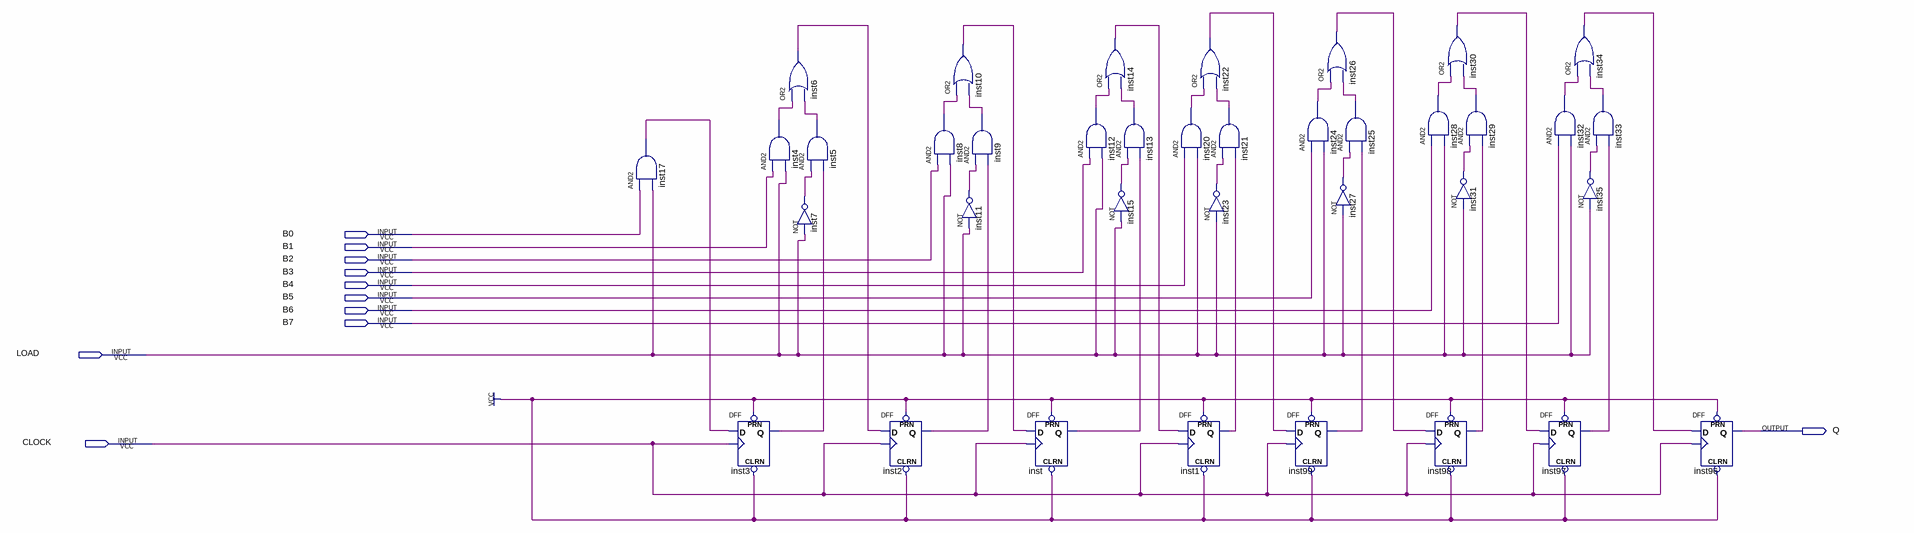
[diagram p0: schematic sheet]
// Quartus schematic PISO.bdf as structural Verilog: 37 symbols, 11 pins
module PISO (
  input  B0,
  input  B1,
  input  B2,
  input  B3,
  input  B4,
  input  B5,
  input  B6,
  input  B7,
  input  LOAD,
  input  CLOCK,
  output Q
);

  wire inst1_q, inst2_q, inst3_q, inst4_out, inst5_out, inst6_out, inst7_out, inst8_out, inst9_out,
       inst10_out, inst11_out, inst12_out, inst13_out, inst14_out, inst15_out, inst17_out, inst20_out,
       inst21_out, inst22_out, inst23_out, inst24_out, inst25_out, inst26_out, inst27_out, inst28_out,
       inst29_out, inst30_out, inst31_out, inst32_out, inst33_out, inst34_out, inst35_out, inst97_q,
       inst98_q, inst99_q, inst_q;

  and inst17 (inst17_out, B0, LOAD);
  DFF inst3 (.CLRN(1'b1), .CLK(CLOCK), .D(inst17_out), .PRN(1'b1), .Q(inst3_q));
  or inst6 (inst6_out, inst4_out, inst5_out);
  and inst4 (inst4_out, B1, LOAD);
  and inst5 (inst5_out, inst7_out, inst3_q);
  not inst7 (inst7_out, LOAD);
  DFF inst2 (.CLRN(1'b1), .CLK(CLOCK), .D(inst6_out), .PRN(1'b1), .Q(inst2_q));
  and inst8 (inst8_out, B2, LOAD);
  or inst10 (inst10_out, inst8_out, inst9_out);
  and inst9 (inst9_out, inst11_out, inst2_q);
  not inst11 (inst11_out, LOAD);
  DFF inst (.CLRN(1'b1), .CLK(CLOCK), .D(inst10_out), .PRN(1'b1), .Q(inst_q));
  and inst12 (inst12_out, B3, LOAD);
  or inst14 (inst14_out, inst12_out, inst13_out);
  and inst13 (inst13_out, inst15_out, inst_q);
  not inst15 (inst15_out, LOAD);
  and inst20 (inst20_out, B4, LOAD);
  DFF inst1 (.CLRN(1'b1), .CLK(CLOCK), .D(inst14_out), .PRN(1'b1), .Q(inst1_q));
  or inst22 (inst22_out, inst20_out, inst21_out);
  and inst21 (inst21_out, inst23_out, inst1_q);
  not inst23 (inst23_out, LOAD);
  DFF inst99 (.CLRN(1'b1), .CLK(CLOCK), .D(inst22_out), .PRN(1'b1), .Q(inst99_q));
  or inst26 (inst26_out, inst24_out, inst25_out);
  and inst24 (inst24_out, B5, LOAD);
  and inst25 (inst25_out, inst27_out, inst99_q);
  not inst27 (inst27_out, LOAD);
  or inst30 (inst30_out, inst28_out, inst29_out);
  and inst28 (inst28_out, B6, LOAD);
  DFF inst98 (.CLRN(1'b1), .CLK(CLOCK), .D(inst26_out), .PRN(1'b1), .Q(inst98_q));
  and inst29 (inst29_out, inst31_out, inst98_q);
  not inst31 (inst31_out, LOAD);
  DFF inst97 (.CLRN(1'b1), .CLK(CLOCK), .D(inst30_out), .PRN(1'b1), .Q(inst97_q));
  or inst34 (inst34_out, inst32_out, inst33_out);
  and inst32 (inst32_out, B7, LOAD);
  and inst33 (inst33_out, inst35_out, inst97_q);
  not inst35 (inst35_out, LOAD);
  DFF inst96 (.CLRN(1'b1), .CLK(CLOCK), .D(inst34_out), .PRN(1'b1), .Q(Q));
endmodule
